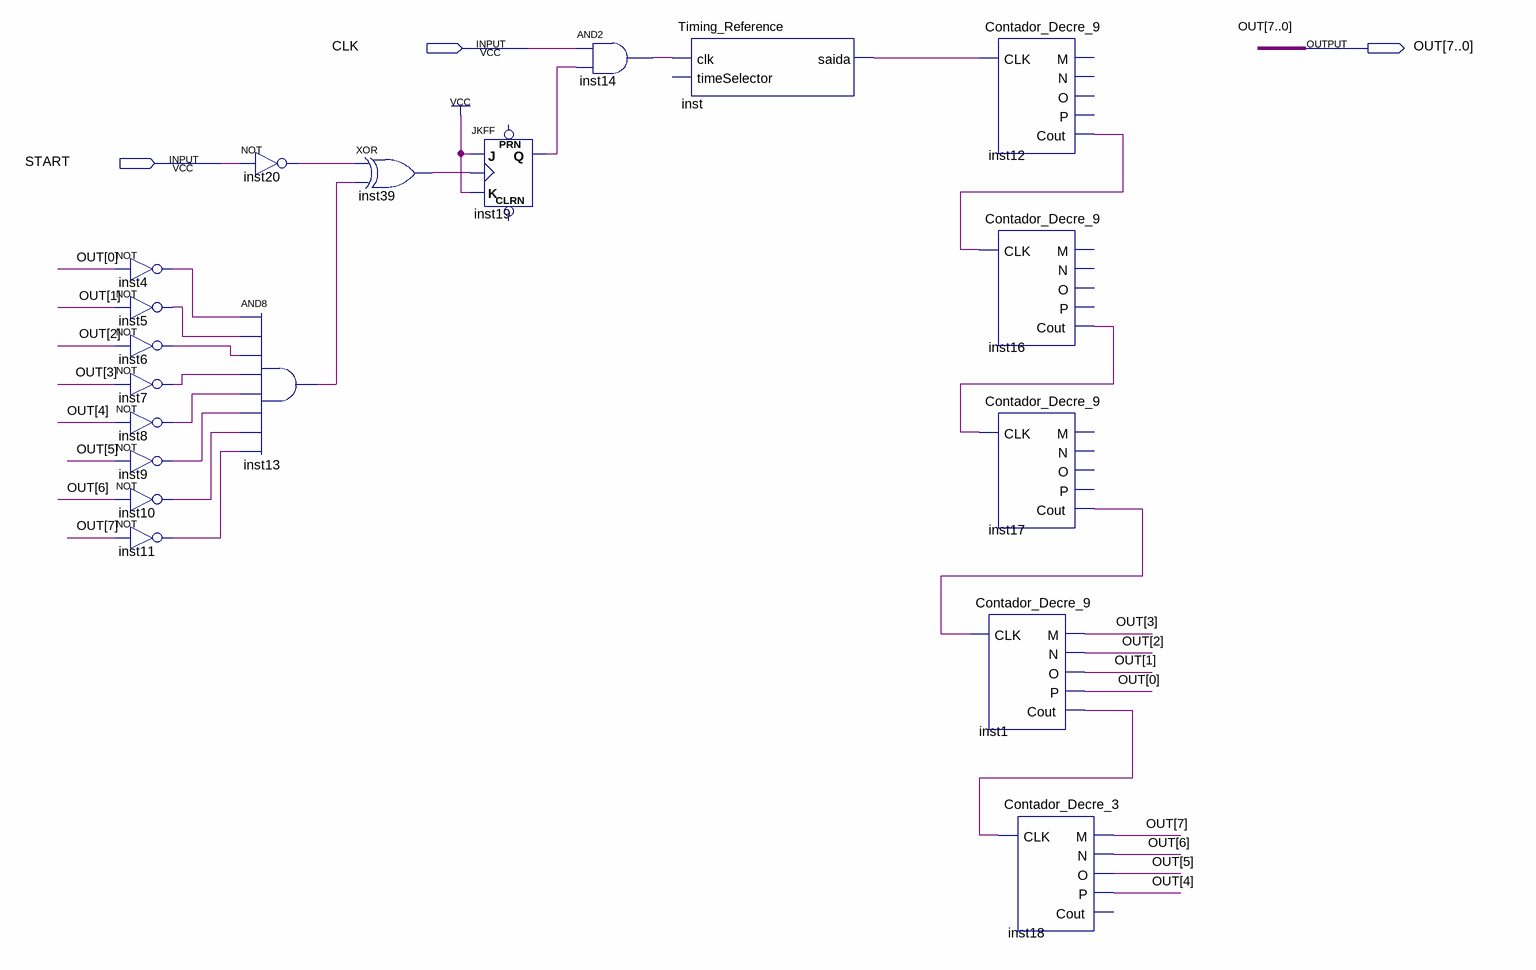
[diagram p0: schematic sheet]
// Quartus schematic Timer_30s.bdf as structural Verilog: 19 symbols, 3 pins
module Timer_30s (
  input  CLK,
  input  START,
  output [7:0] OUT
);

  wire inst1_cout, inst4_out, inst5_out, inst6_out, inst7_out, inst8_out, inst9_out, inst10_out, inst11_out,
       inst12_cout, inst13_out, inst14_out, inst16_cout, inst17_cout, inst19_q, inst20_out, inst39_out,
       inst_saida;

  not inst4 (inst4_out, OUT[0]);
  not inst5 (inst5_out, OUT[1]);
  not inst6 (inst6_out, OUT[2]);
  not inst7 (inst7_out, OUT[3]);
  not inst8 (inst8_out, OUT[4]);
  not inst9 (inst9_out, OUT[5]);
  not inst10 (inst10_out, OUT[6]);
  not inst11 (inst11_out, OUT[7]);
  not inst20 (inst20_out, START);
  and inst13 (inst13_out, inst4_out, inst5_out, inst6_out, inst7_out, inst8_out, inst9_out, inst10_out, inst11_out);
  xor inst39 (inst39_out, inst20_out, inst13_out);
  JKFF inst19 (.K(1'b1), .J(1'b1), .CLK(inst39_out), .Q(inst19_q));  // open: PRN, CLRN
  and inst14 (inst14_out, CLK, inst19_q);
  Timing_Reference inst (.clk(inst14_out), .saida(inst_saida));  // open: timeSelector
  Contador_Decre_9 inst12 (.CLK(inst_saida), .Cout(inst12_cout));  // open: M, N, O, P
  Contador_Decre_9 inst16 (.CLK(inst12_cout), .Cout(inst16_cout));  // open: M, N, O, P
  Contador_Decre_9 inst17 (.CLK(inst16_cout), .Cout(inst17_cout));  // open: M, N, O, P
  Contador_Decre_9 inst1 (.CLK(inst17_cout), .M(OUT[3]), .N(OUT[2]), .O(OUT[1]), .P(OUT[0]), .Cout(inst1_cout));
  Contador_Decre_3 inst18 (.CLK(inst1_cout), .M(OUT[7]), .N(OUT[6]), .O(OUT[5]), .P(OUT[4]));  // open: Cout
endmodule
